# Altium schematic sheet [03] - POWER DIAGRAM.SchDoc
size A3; DocumentNumber: 2; SheetNumber: 2; SheetTotal: 4; .Checked PCB: .; .Checked SCH: .
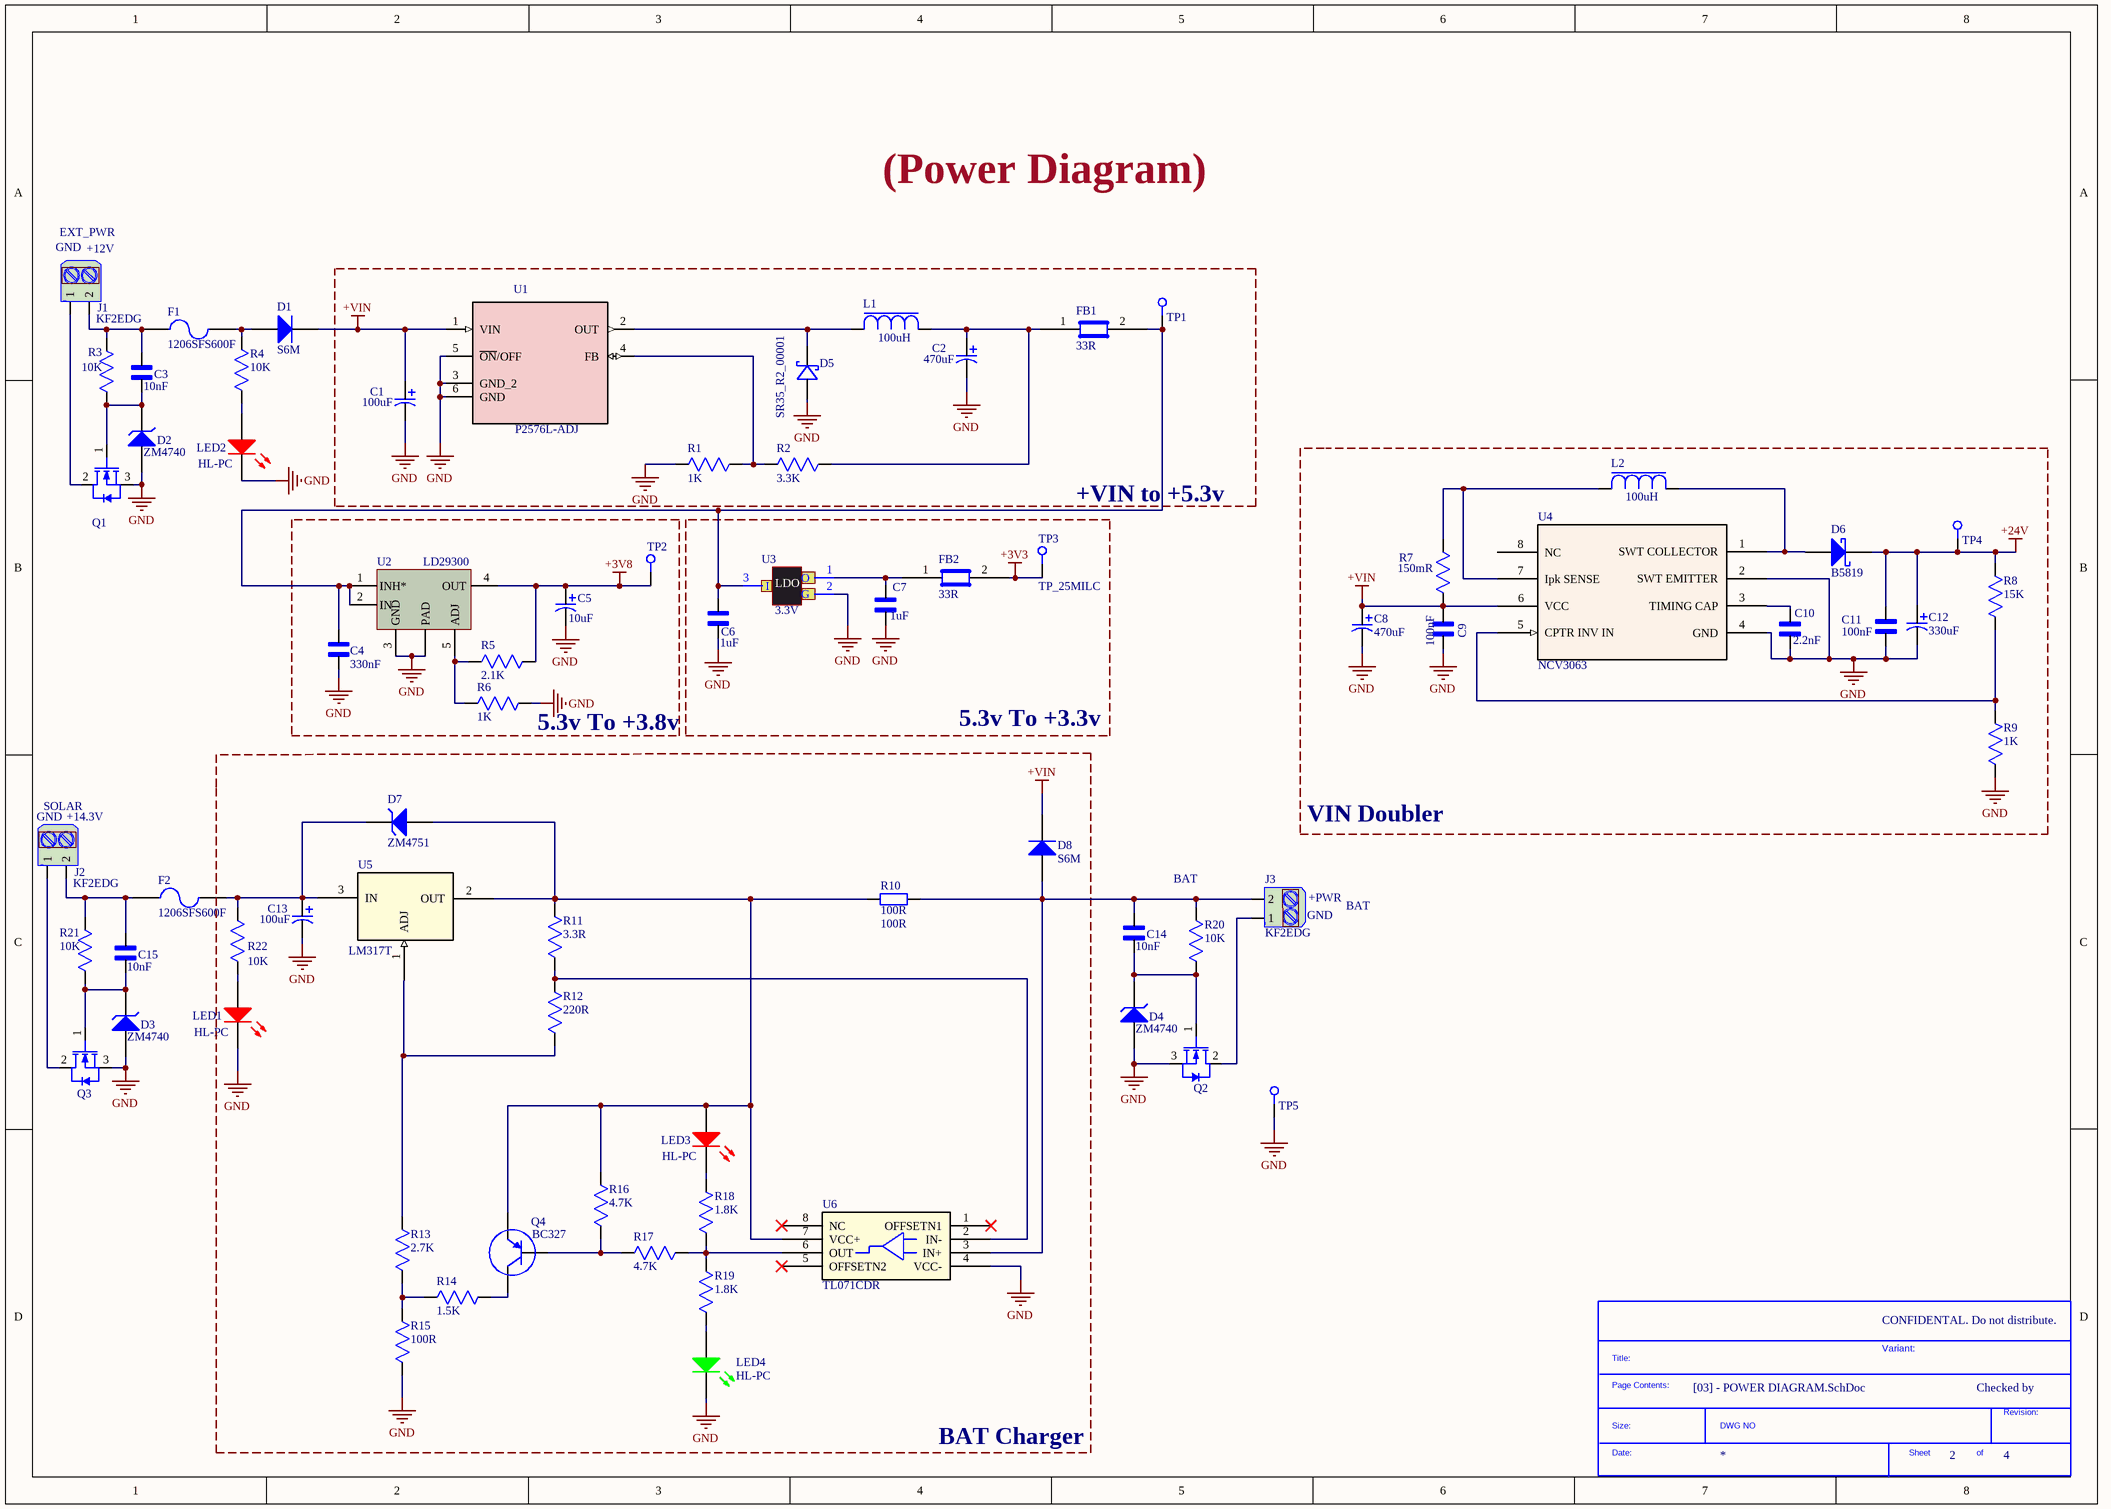
[diagram p0: [03] - POWER DIAGRAM.SchDoc]

## Parts
*  SDTitleBlock  (value not drawn)  (graphical)
C1  100uF  [CAP_Al_1010]
C2  470uF  [CAP_Al_1010]
C3  10nF  [CAP_0805]
C4  330nF  [CAP_0805]
C5  10uF  [CAP_AL_0553]
C6  1uF  [CAP_0805]
C7  1uF  [CAP_0805]
C8  470uF  [CAP_Al_1010]
C9  100nF  [CAP_0805]
C10  2.2nF  [CAP_0805]
C11  100nF  [CAP_0805]
C12  330uF  [CAP_AL_THT_10X20X5MM]
C13  100uF  [CAP_Al_1010]
C14  10nF  [CAP_0805]
C15  10nF  [CAP_0805]
D1  S6M  [DO-214AB]
D2  ZM4740  [MELF]
D3  ZM4740  [MELF]
D4  ZM4740  [MELF]
D5  SR35_R2_00001  [DO214AA]
D6  B5819  [SOD123]
D7  ZM4751  [MELF]
D8  S6M  [DO-214AB]
F1  1206SFS600F  [FUS_1206]
F2  1206SFS600F  [FUS_1206]
FB1  33R  [FB_0603]
FB2  33R  [FB_0603]
J1  KF2EDG  [TERM_BLK_2P_F]
J2  KF2EDG  [TERM_BLK_2P_F]
J3  KF2EDG  [TERM_BLK_2P_F]
L1  100uH  [IND_1212]
L2  100uH  [IND_1212]
LED1  HL-PC  [LED_RED_1206]
LED2  HL-PC  [LED_RED_1206]
LED3  HL-PC  [LED_RED_1206]
LED4  HL-PC  [LED_GREEN_1206]
Q1  NDT3055L  [SOT223]  (value not drawn)
Q2  NDT3055L  [SOT223]  (value not drawn)
Q3  NDT3055L  [SOT223]  (value not drawn)
Q4  BC327  [TO-92]
R1  1K  [RES_0805]
R2  3.3K  [RES_0805]
R3  10K  [RES_0805]
R4  10K  [RES_0805]
R5  2.1K  [RES_0805]
R6  1K  [RES_0805]
R7  150mR  [RES_2512]
R8  15K  [RES_0805]
R9  1K  [RES_1206]
R10  100R  [RES_AXL_22X9]
R11  3.3R  [RES_0805]
R12  220R  [RES_0805]
R13  2.7K  [RES_0805]
R14  1.5K  [RES_0805]
R15  100R  [RES_0805]
R16  4.7K  [RES_0805]
R17  4.7K  [RES_0805]
R18  1.8K  [RES_0805]
R19  1.8K  [RES_0805]
R20  10K  [RES_0805]
R21  10K  [RES_0805]
R22  10K  [RES_0805]
TP1  TP_25MILC  [TP]  (value not drawn)  (no BOM)
TP2  TP_25MILC  [TP]  (value not drawn)  (no BOM)
TP3  TP_25MILC  [TP]  (no BOM)
TP4  TP_25MILC  [TP]  (value not drawn)  (no BOM)
TP5  TP_25MILC  [TP]  (value not drawn)  (no BOM)
U1  P2576L-ADJ  [TO170P1435X465-6N]
U2  LD29300  [D2PAK/A]
U3  3.3V  [SOT-23]
U4  NCV3063  [SOIC-8]
U5  LM317T  [TO-220AB]
U6  TL071CDR  [SOIC-8]

## Blocks framed on the sheet
VIN Doubler: C8-C12 D6 L2 R7-R9 TP4 U4
5.3v To +3.8v: C4 C5 R5 R6 TP2 U2
BAT Charger: C13 D7 D8 LED1 LED3 LED4 Q4 R10-R19 R22 U5 U6

## Nets
+3V3: FB2.2 TP3.1
+3V8: C5.1 R5.1 TP2.1 U2.4(OUT)
+24V: C11.1 C12.1 D6.1(K) R8.1 TP4.1
+VIN: C1.1 C8.1 C9.1 D1.1(K) D8.1(K) R7.1 U1.1(VIN) U4.6(VCC)
GND: C1.2 C2.2 C4.1 C5.2 C6.1 C7.1 C8.2 C9.2 C10.2 C11.2 C12.2 C13.2 D2.2(A) D3.2(A) D4.2(A) D5.2 LED1.1(K) LED2.1(K) LED4.1(K) Q1.3(S) Q2.3(S) Q3.3(S) R1.2 R6.2 R9.1 R15.2 TP5.1 U1.3(GND_2) U1.5(~{ON}/OFF) U1.6(GND) U2.3(GND) U2.PAD U3.2(G) U4.2(SWT_EMITTER) U4.4(GND) U6.4(VCC-)
NetC2_1: C2.1 FB1.1 L1.1 R2.1
NetC3_1: C3.1 D2.1(K) Q1.1(G) R3.2
NetC3_2: C3.2 F1.2 J1.2 R3.1
NetC4_2: C4.2 C6.2 FB1.2 TP1.1 U2.1(INH*) U2.2(IN) U3.3(I)
NetC7_2: C7.2 FB2.1 U3.1(O)
NetC10_1: C10.1 U4.3(TIMING_CAP)
NetC13_1: C13.1 D7.1(K) F2.1 R22.1 U5.3(IN)
NetC14_1: C14.1 D4.1(K) Q2.1(G) R20.2
NetC14_2: C14.2 D8.2(A) J3.2 R10.2 R20.1 U6.3(IN+)
NetC15_1: C15.1 D3.1(K) Q3.1(G) R21.2
NetC15_2: C15.2 F2.2 J2.2 R21.1
NetD1_2: D1.2(A) F1.1 R4.1
NetD5_1: D5.1 L1.2 U1.2(OUT)
NetD6_2: D6.2(A) L2.1 U4.1(SWT_COLLECTOR)
NetD7_2: D7.2(A) LED3.2(A) Q4.3(E) R10.1 R11.1 R16.1 U5.2(OUT) U6.7(VCC+)
NetJ1_1: J1.1 Q1.2(D)
NetJ2_1: J2.1 Q3.2(D)
NetJ3_1: J3.1 Q2.2(D)
NetL2_2: L2.2 R7.2 U4.7(Ipk_SENSE)
NetLED1_2: LED1.2(A) R22.2
NetLED2_2: LED2.2(A) R4.2
NetLED3_1: LED3.1(K) R18.1
NetLED4_2: LED4.2(A) R19.2
NetQ4_1: Q4.1(C) R14.1
NetQ4_2: Q4.2(B) R16.2 R17.2
NetR1_1: R1.1 R2.2 U1.4(FB)
NetR5_2: R5.2 R6.1 U2.5(ADJ)
NetR8_2: R8.2 R9.2 U4.5(CPTR_INV_IN)
NetR11_2: R11.2 R12.1 U6.2(IN-)
NetR12_2: R12.2 R13.1 U5.1(ADJ)
NetR13_2: R13.2 R14.2 R15.1
NetR17_1: R17.1 R18.2 R19.1 U6.6(OUT)

Not connected (* = marked no-connect by the designer): U4 8(NC); U6 1(OFFSETN1)* 5(OFFSETN2)* 8(NC)*

## Notes on the sheet
- EXT_PWR
- (Power Diagram)
- (near J1) GND
- (near J1) +12V
- +VIN to +5.3v
- 5.3v To +3.3v
- (near J2) GND
- (near J2) SOLAR
- (near J2) +14.3V
- (near R20) BAT
- (near J3) GND
- (near J3) +PWR
- BAT
- CONFIDENTAL. Do not distribute.
- Variant:
- Checked by
- (in symbol MCP1700) LDO
- (in symbol SDTitleBlock) Title:; Page Contents:; Revision:; Size:; DWG NO; Date:; Sheet; of

## Library data of the parts
C1 C13 = CAP_AL_1010: =Product Description; Product Name: BXJ63VC100MJ10TP; Product Description: CAP.EL.100uF 63V 10x10 105C 5000Hrs SMD; .Checked PCB: CHK; Value: 100uF; Dimensions (mm) DxL: 10.00x10.00; .Checked SCH: CHK
C2 = CAP_AL_1010: =Product Description; Product Name: BDS25VC470MJ10TP; Product Description: CAP.EL.470uF 25V 10x10 105C 2000Hrs SMD ±20%; .Checked PCB: CHK; Value: 470uF; Dimensions (mm) DxL: 10.00x10.00; .Checked SCH: CHK
C3 C14 = CAP_0805: Product Name: CL21C103JBFNNNE; Product Description: MLCC (2012) 0805 10nF 50VDC ±5% C0G (NP0); .Checked PCB: CHK; Package: 0805; Value: 10nF; .Checked SCH: CHK
C4 = CAP_0805: =Product Description; Manufacturer: SAMSUNG; Product Name: CL21B334KOCNNNC; Product Description: MLCC (2012) 0805 330nF 16VDC ±10% X7R; .Checked PCB: CHK; Value: 330nF; Package / Case: 0805; .Checked SCH: CHK
C5 = CAP_AL_0553: =Product Description; Manufacturer: SAMWHA; Product Name: SC1V106M05005VR; Product Description: CAP.EL.10uF 35V 5x5.3 85C SMD SAMWHA; .Checked PCB: CHK; Value: 10uF; .Checked SCH: CHK
C6 C7 = CAP_0805: Product Name: CL21F105ZBFNNNE; Product Description: MLCC (2012) 0805 1uF 50VDC -20% +80% Y5V; .Checked PCB: CHK; Package: 0805; Value: 1uF; .Checked SCH: CHK
C8 = CAP_AL_1010: =Product Description; Product Name: BDS25VC470MJ10TP; Product Description: CAP.EL.470uF 25V 10x10 105C 2000Hrs SMD; .Checked PCB: CHK; Value: 470uF; Dimensions (mm) DxL: 10.00x10.00; .Checked SCH: CHK
C9 C11 = CAP_0805: Product Name: CL21B104JBCNNNC; Product Description: MLCC (2012) 0805 100nF 50VDC ±5% X7R; .Checked PCB: CHK; Package: 0805; Value: 100nF; .Checked SCH: CHK
C10 = CAP_0805: =Product Description; Product Name: CL21B222JBANNNC; Product Description: MLCC (2012) 0805 2.2nF 50VDC ±5% X7R; .Checked PCB: CHK; Package: 0805; Value: 2.2nF; .Checked SCH: CHK
C12 = CAP_AL_THT_10X12X5MM: =Product Description; Manufacturer: SAMWHA; Product Name: LQ1H337M10020PA; Product Description: CAP.EL.330uF 50V 10x20 105C 10000H TB; .Checked PCB: CHK; Value: 330uF; .Checked SCH: CHK
C15 = CAP_0805: Product Name: CL21C103JBFNNNE; Product Description: MLCC (2012) 0805 10nF 50VDC ±5% C0G (NP0); .Checked PCB: .; Package: 0805; Value: 10nF; .Checked SCH: .
D1 D8 = DID_DO214: =Product Description; Product Name: S6M-DC; Product Description: DIODE 6A 1000V SMT DO214AB (SMC); .Checked PCB: CHK; Package: DO214AB; Value: S6M; .Checked SCH: CHK
D2 D3 = DID_ZEN_MELF: =Product Description; Product Name: ZM4740A-HT; Product Description: DIODE ZENER 1W 10V ±5% LL-41 (MELF) SMT; .Checked PCB: .; Package: MELF; Value: ZM4740; .Checked SCH: .
D4 = DID_ZEN_MELF: =Product Description; Product Name: ZM4740A-HT; Product Description: DIODE ZENER 1W 10V ±5% LL-41 (MELF) SMT; .Checked PCB: CHK; Package: MELF; Value: ZM4740; .Checked SCH: CHK
D5 = D_SCK_DO214AA: Product Description; Manufacturer: PANJIT; Product Description: DIODE SCHOTTKY 3A 50V DO214AA SMB PANJIT; .Checked PCB: CHK; Product Name: SR35_R2_00001; Package / Case: DO214AA; .Checked SCH: CHK
D6 = DID_SCHK_SOD123: =Product Description; Product Name: B5819W; Product Description: DIODE SCHOTTKY 1A 40V SOD123; .Checked PCB: CHK; Package: SOD123; Value: B5819; .Checked SCH: CHK
D7 = DID_ZEN_MELF: =Product Description; Product Name: ZM4751A-HT; Product Description: DIODE ZENER 1W 30V ±5% LL-41 (MELF) SMT; .Checked PCB: .; Package: MELF; Value: ZM4751; .Checked SCH: .
F1 = FUZ_SMD_1206: =Product Description; Product Name: 1206SFS600F/24-2; Product Description: FUSE BOARD MOUNT 6A 24VDC 1206; .Checked PCB: CHK; Package: 1206; Value: 1206SFS600F; .Checked SCH: CHK
F2 = FUZ_SMD_1206: =Product Description; Product Name: 1206SFS600F/24-2; Product Description: FUSE BOARD MOUNT 6A 24VDC 1206; .Checked PCB: .; Package: 1206; Value: 1206SFS600F; .Checked SCH: .
FB1 FB2 = FB_0603: =Product Description; Manufacturer: MURATA; Product Name: BLM18PG330SN1D; Product Description: FERRITE BEAD 0603 33R 3A MURATA; .Checked PCB: CHK; Value: 33R; Package / Case: 0603; .Checked SCH: CHK
J1-J3 = TERM_BLK_2POS_F: =Product Description; Product Name: KF2EDG-5.08-2P-14; Product Description: TERM.BLK.5.08MM 2P FEMALE GREEN; ComponentLink1URL: https://www.ozdisan.com/konnektor-ve-baglanti-elemanlari/klemensler/gecmeli-klemensler/KF2EDG-5-08-2P-14; ComponentLink1Description: TERM.BLK.5.08MM 2P FEMALE GREEN; Value: KF2EDG
L1 L2 = IND_1212: =Product Description; Product Name: SRI1207-101M; Product Description: INDUCTOR POWER 100UH 12X12X8MM SMD; .Checked PCB: CHK; Inductance: 100uH; Dimensions (mm) LxWxH: 12.00x12.00x8.00; .Checked SCH: CHK; Value: 100uH
LED1 LED3 = LED_RED_1206: =Product Description; Manufacturer: HONGLITRONIC; Product Description: LED SMD 1206 RED WATER CLEAR 90-120 mcd 140C; Product Name: HL-PC-3216S9AC; Color: RED; .Checked PCB: CHK; Value: HL-PC; .Checked SCH: CHK
LED2 = LED_RED_1206: =Product Description; Manufacturer: HONGLITRONIC; Product Description: LED SMD 1206 RED WATER CLEAR 90-120 mcd 140C; Product Name: HL-PC-3216S9AC; Color: RED; .Checked PCB: .; Value: HL-PC; .Checked SCH: .
LED4 = LED_GREEN_1206: =Product Description; Manufacturer: HONGLITRONIC; Product Description: LED SMD 1206 GREEN WATER CLEAR 600-800mcd; Product Name: HL-PC-3216U51GC; Color: GREEN; .Checked PCB: CHK; Value: HL-PC; .Checked SCH: CHK
Q1-Q3 = MOSFET_N_SOT223: =Product Description; Manufacturer: ONS; Product Description: MOSFET DIS.4A 60V N-CH SOT223 ENHANCEMENT SMT; .Checked PCB: CHK; Product Name: NDT3055L; Package / Case: SOT223; Value: NDT3055L; .Checked SCH: CHK
Q4 = BJT_PNP_THT_CBE: =Product Description; Product Name: BC327-40ZL1G; Product Description: TRANSISTOR DIS.500mA 50V PNP TO92 AMP THT	TRANSISTOR DIS.500mA 50V PNP TO92 AMP THT; Package: TO-92; Value: BC327
R1 = RES_0805: =Product Description; Product Name: 0805S8F1001T5E; Product Description: RES.(2012) 0805 1K Ohms 1% 1/8W-S 100PPM; Tolerance: ±1%; Watt: 1/8W-S; .Checked PCB: CHK; Package / Case: 0805; Value: 1K; .Checked SCH: CHK
R2 = RES_0805: =Product Description; Product Name: 0805S8F3301T5E; Product Description: RES.(2012) 0805 3.3K Ohms 1% 1/8W-S 100PPM; Tolerance: ±1%; Watt: 1/8W-S; .Checked PCB: CHK; Package / Case: 0805; Value: 3.3K; .Checked SCH: CHK
R3 R22 = RES_0805: =Product Description; Product Name: 0805S8F1002T5E; Product Description: RES.(2012) 0805 10K Ohms 1% 1/8W-S 100PPM; Tolerance: ±1%; Watt: 1/8W-S; .Checked PCB: CHK; Package / Case: 0805; Value: 10K; .Checked SCH: CHK
R4 R20 R21 = RES_0805: =Product Description; Product Name: 0805S8F1002T5E; Product Description: RES.(2012) 0805 10K Ohms 1% 1/8W-S 100PPM; Tolerance: ±1%; Watt: 1/8W-S; .Checked PCB: .; Package / Case: 0805; Value: 10K; .Checked SCH: .
R5 = RES_0805: =Product Description; Product Name: 0805S8F2101T5E; Product Description: RES.(2012) 0805 2.1K Ohms 1% 1/8W-S 100PPM; Tolerance: ±1%; Watt: 1/8W-S; .Checked PCB: CHK; Package / Case: 0805; Value: 2.1K; .Checked SCH: CHK
R6 = RES_0805: =Product Description; Product Name: 0805S8J0102T5E; Product Description: RES.(2012) 0805 1K Ohms 5% 1/8W-S 100PPM; Tolerance: ±5%; Watt: 1/8W-S; .Checked PCB: CHK; Package / Case: 0805; Value: 1K; .Checked SCH: CHK
R7 = RES_2512: =Product Description; Product Name: HP122WF150LT4E; Product Description: RES.(6432) 2512 150m Ohms 1% 2W 200PPM; .Checked PCB: .; Package: 2512; Value: 150mR; .Checked SCH: .
R8 = RES_0805: =Product Description; Product Name: 0805S8J0153T5E; Product Description: RES.(2012) 0805 15K Ohms 5% 1/8W-S 100PPM; .Checked PCB: .; Package: 0805; Value: 15K; .Checked SCH: .
R9 = RES_1206: =Product Description; Product Name: 1206S4F1001T5E; Product Description: RES.(3216) 1206 1K Ohms 1% 1/4W-S 100PPM; Tolerance: ±1%; Watt: 1/4W-S; Package / Case: 1206 (3216 Metric); Value: 1K; .Checked PCB: 1206S4F1001T5E; .Checked SCH: 1206S4F1001T5E
R10 = RES_AXL_20X9: =Product Description; Product Name: PRW05WJP101B00; Product Description: RES.CEMENT 5W 100 Ohms 5% THT; .Checked PCB: CHK; Package: AXIAL; Value: 100R; .Checked SCH: CHK
R11 = RES_0805: =Product Description; Product Name: RC2012F3R3CS; Product Description: RES.(2012) 0805 3.3 Ohms 1% 1/8W +300PPM~-200PPM; Tolerance: ±1%; Watt: 1/8W; .Checked PCB: CHK; Package / Case: 0805; Value: 3.3R; .Checked SCH: CHK
R12 = RES_0805: =Product Description; Product Name: ERJ-P06D2200V; Product Description: RES.(2012) 0805 220 Ohms 0.5% 1/2W 100PPM; Tolerance: ±0.5%; Watt: 1/2W; .Checked PCB: CHK; Package / Case: 0805; Value: 220R; .Checked SCH: CHK
R13 = RES_0805: =Product Description; Product Name: 0805S8F2701T5E; Product Description: RES.(2012) 0805 2.7K Ohms 1% 1/8W-S 100PPM; Tolerance: ±1%; Watt: 1/8W-S; .Checked PCB: CHK; Package / Case: 0805; Value: 2.7K; .Checked SCH: CHK
R14 = RES_0805: =Product Description; Product Name: 0805S8F1501T5E; Product Description: RES.(2012) 0805 1.5K Ohms 1% 1/8W-S 100PPM; Tolerance: ±1%; Watt: 1/8W-S; .Checked PCB: CHK; Package / Case: 0805; Value: 1.5K; .Checked SCH: CHK
R15 = RES_0805: =Product Description; Product Name: 0805S8F1000T5E; Product Description: RES.(2012) 0805 100 Ohms 1% 1/8W-S 200PPM; Tolerance: ±1%; Watt: 1/8W-S; .Checked PCB: CHK; Package / Case: 0805; Value: 100R; .Checked SCH: CHK
R16 R17 = RES_0805: =Product Description; Product Name: 0805S8J0472T5E; Product Description: RES.(2012) 0805 4.7K Ohms 5% 1/8W-S 100PPM; Tolerance: ±5%; Watt: 1/8W-S; .Checked PCB: CHK; Package / Case: 0805; Value: 4.7K; .Checked SCH: CHK
R18 R19 = RES_0805: =Product Description; Product Name: 0805S8J0182T5E; Product Description: RES.(2012) 0805 1.8K Ohms 5% 1/8W-S 100PPM; Tolerance: ±5%; Watt: 1/8W-S; .Checked PCB: CHK; Package / Case: 0805; Value: 1.8K; .Checked SCH: CHK
TP1 TP4 TP5 = TP_25MILC: Test Point 25mil; .Checked PCB: CHK; .Checked SCH: CHK
TP2 = TP_25MILC: Test Point 25mil; .Checked PCB: .; .Checked SCH: .
TP3 = TP_25MILC: Test Point 25mil
U1 = P2576L-AD-TQ5-R: IC-2576 V.REG.3A ADJ SIMPL.STEP-DOWN SMD TO-263; Manufacturer: UTC; .Checked PCB: CHK; Product Name: P2576L-AD-TQ5-R; Product Description: IC-2576 V.REG.3A ADJ SIMPL.STEP-DOWN SMD TO-263; Package / Case: TO263-5 (D2PAK-5); .Checked SCH: CHK
U2 = LD29300: =Product Description; Manufacturer: STM; Product Name: LD29300P2MTR; Product Description: IC-29300 REG. LDO. ADJ 3A P2PAK/A; .Checked SCH: CHK; Package / Case: P2PAK/A; .Checked PCB: CHK; Value: LD29300
U3 = MCP1700: =Product Description; Product Name: MCP1700T-3302E/TT; Product Description: IC-1700 REG LDO 3.3V 0.25A SOT23-3; .Checked SCH: CHK; Package / Case: SOT23-3; Value: 3.3V; .Checked PCB: CHK
U4 = NCV3063DR2G: =Product Description; Product Description: IC-3063 INV. SWITCHING REGULATORS SOIC8 SMD ONS; .Checked PCB: CHK; Product Name: NCV3063DR2G; Package: SOIC8; Value: NCV3063; .Checked SCH: CHK
U5 = LM317T: =Product Description; Product Name: LM317T-DG; Product Description: IC-317 V.REG/STABILIZER 1.5A TO220 DOUBLE GAUG ST; Value: LM317T; Package: TO220-3
U6 = TL071CDR: =Product Description; Manufacturer: SOIC8; Product Description: IC-071 OPAMP JFET 3MHZ SOIC8; Value: TL071CDR; Product Name: TL071CDR; Package: SOIC8